# Altium schematic sheet Sheet1-BeforeClearParameters-20261026_105055_830.SchDoc
size A4; SheetNumber: 1; SheetTotal: 1
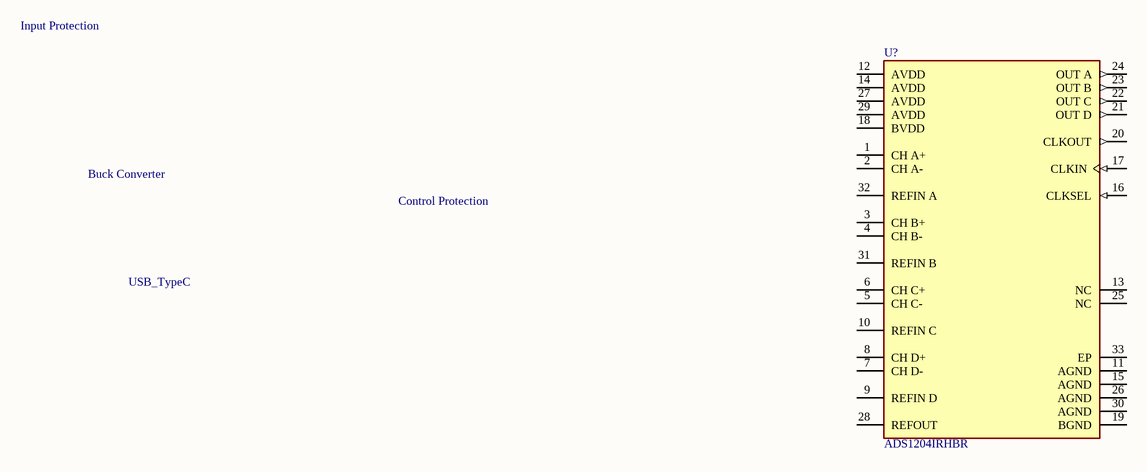
[diagram p0: Sheet1-BeforeClearParameters-20261026_105055_830.SchDoc]

## Parts
U?  ADS1204IRHBR  [FP-RHB0032D-MFG]

## Nets

Not connected (* = marked no-connect by the designer): U? 1(CH_A+) 2(CH_A-) 3(CH_B+) 4(CH_B-) 5(CH_C-) 6(CH_C+) 7(CH_D-) 8(CH_D+) 9(REFIN_D) 10(REFIN_C) 11(AGND) 12(AVDD) 13(NC) 14(AVDD) 15(AGND) 16(CLKSEL) 17(CLKIN) 18(BVDD) 19(BGND) 20(CLKOUT) 21(OUT_D) 22(OUT_C) 23(OUT_B) 24(OUT_A) 25(NC) 26(AGND) 27(AVDD) 28(REFOUT) 29(AVDD) 30(AGND) 31(REFIN_B) 32(REFIN_A) 33(EP)

## Notes on the sheet
- Input Protection
- Buck Converter
- Control Protection
- USB_TypeC

## Library data of the parts
U? = CMP-0003-00933-2: IC MODULATOR 16BIT 40K 32VQFN; Differential Nonlinearity: 1LSB; Power Dissipation: 122mW; Sampling Rate: 40000S/s; Interface: Serial; Supply Type: Analog; Max Supply Voltage (DC): 5.5V; Max Power Dissipation: 150mW; Nominal Supply Current: 22.5mA; Number of Inputs: 4; Polarity: Bipolar; Signal to Noise Ratio (SNR): 89dB; Number of Bits: 16; Conversion Rate: 40KS/s; Max Supply Voltage: 5.25V; Integral Nonlinearity (INL): 3LSB; Spurious-free dynamic range (SFDR): 100dB; Resolution: 16b; Min Supply Voltage (DC): 2.7V; Input Type: DIFFERENTIAL; Min Supply Voltage: 4.75V; Packaging: Tape and Reel; Number of Pins: 32; Case/Package: VQFN; Package Quantity: 3000; Min Operating Temperature: -40°C; Number of A/D Converters: 4; RoHS Compliant: Yes; Series: -; Radiation Hardening: No; Power Consumption: 122mW; Lead Free: Lead Free; Max Operating Temperature: 105°C; Number of Channels: 4; Contact Plating: Gold; Number of Analog Inputs: 4; Number of Converters: 4